# Altium schematic sheet Sheet5_Proteção_Bateria.SchDoc
size A4; SheetNumber: 5; SheetTotal: 6
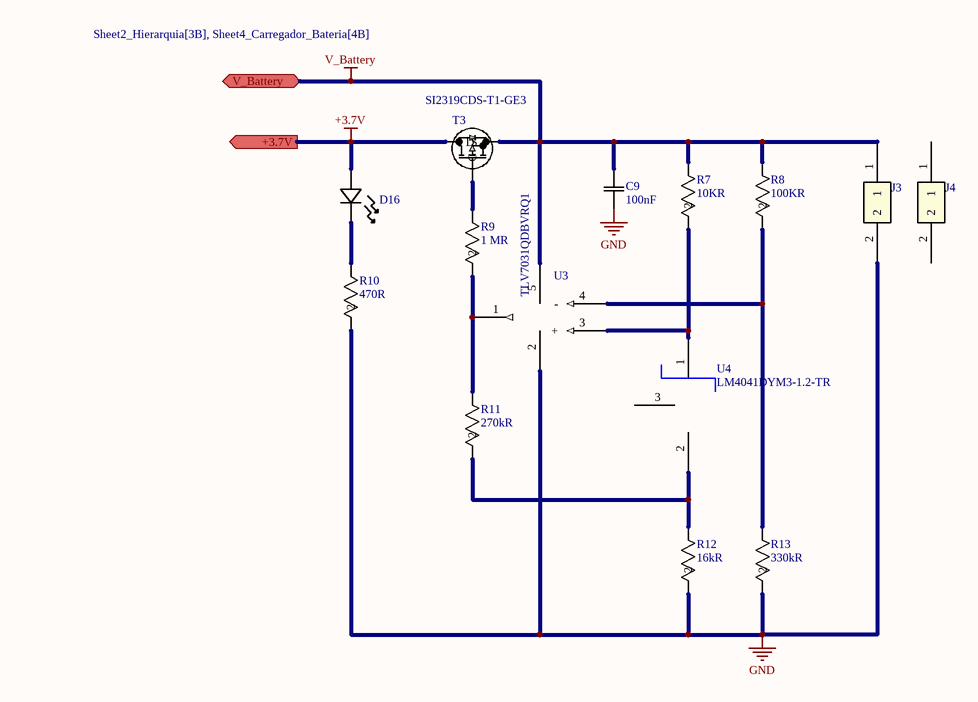
[diagram p0: Sheet5_Proteção_Bateria.SchDoc]

## Parts
?  (no value)  (graphical)
C9  100nF  [CAP_CL21_SAM]
D16  VAOL-S8SB4  [LED_VCCLITE_0805_VCC]  (value not drawn)
J3  TSW-101-07-G-D  [TSW-101-07-G-D_SAI]  (value not drawn)
J4  TSW-101-07-G-D  [TSW-101-07-G-D_SAI]  (value not drawn)
R7  10KR  [RES0805_CRG_TYCO_TYC]
R8  100KR  [RES0805_CRG_TYCO_TYC]
R9  1 MR  [RC0805N_PAN]
R10  470R  [RC0805N_VIS]
R11  270kR  [RC0805N_PAN]
R12  16kR  [RC0805N_PAN]
R13  330kR  [RC0805N_PAN]
T3  SI2319CDS-T1-GE3  [SOT-23-3_TO-236_VIS]
U3  TLV7031QDBVRQ1  [SOT_DBVRQ1_TEX]
U4  LM4041DYM3-1.2-TR  [SOT-23_MC_MCH]

## Ports
+3.7V (out, see Sheet2_Hierarquia[3B], Sheet6_Power_Path[2A]), V_Battery (bidir, see Sheet2_Hierarquia[3B], Sheet4_Carregador_Bateria[4B])

## Nets
+3.7V: D16.2 T3.3(D) ; port +3.7V
GND: C9.1 J3.2 R10.2 R12.2 R13.2 U3.2(VEE)
V_Battery: C9.2 J3.1 R7.1 R8.1 T3.2(S) U3.5(VCC) ; port V_Battery
NetD16_1: D16.1 R10.1
NetR7_2: R7.2 U3.3(+) U4.1(+)
NetR8_2: R8.2 R13.1 U3.4(-)
NetR9_1: R9.1 T3.1(G)
NetR9_2: R9.2 R11.1 U3.1(OUT)
NetR11_2: R11.2 R12.1 U4.2(-)

Not connected (* = marked no-connect by the designer): J4 1 2; U4 3(NC)

## Notes on the sheet
- Título:
- Endereço:
- Rua Aprígio Veloso, 1500 - Bodocongó
  CEP:58.429-140
  Campina Grande, Paraíba
  Brasil
- Projeto:
- Conta:
- Projetista:
- Arquivo:
- Data:
- Revisor:
- Pág.:
- Rev.:
- de

## Library data of the parts
? = Title Block
C9 = CL21B104KACNNNC: Description; Manufacturer_Name: Samsung; Copyright: Copyright (C) 2025 Ultra Librarian. All rights reserved.; Manufacturer_Part_Number: CL21B104KACNNNC
D16 = VAOL-S8SB4: No Description Available; Manufacturer_Name: VCC; Copyright: Copyright (C) 2026 Ultra Librarian. All rights reserved.; Manufacturer_Part_Number: VAOL-S8SB4
J3 J4 = TSW-101-07-G-D: No Description Available; Manufacturer_Name: Samtec Inc; Copyright: Copyright (C) 2026 Ultra Librarian. All rights reserved.; Manufacturer_Part_Number: TSW-101-07-G-D; RefDes: RefDes; Type: Type
R7 = CRG0805F10K: CRG0805 1% 10K; Manufacturer_Name: TE Connectivity; Copyright: Copyright (C) 2026 Ultra Librarian. All rights reserved.; Manufacturer_Part_Number: CRG0805F10K
R8 = CRG0805F100K: CRG0805 1% 100K; Manufacturer_Name: TE Connectivity; Copyright: Copyright (C) 2026 Ultra Librarian. All rights reserved.; Manufacturer_Part_Number: CRG0805F100K; Datasheet: https://www.te.com/commerce/DocumentDelivery/DDEController?Action=srchrtrv&DocNm=1773204&DocType=Data+Sheet&DocLang=English&PartCntxt=1623095-1&DocFormat=pdf
R9 = ERJ-6ENF1004V: Description; Manufacturer_Name: Panasonic; Copyright: Copyright (C) 2026 Ultra Librarian. All rights reserved.; Manufacturer_Part_Number: ERJ-6ENF1004V
R10 = CRCW0805470RJNEA: No Description Available; Manufacturer_Name: Vishay; Copyright: Copyright (C) 2026 Ultra Librarian. All rights reserved.; Manufacturer_Part_Number: CRCW0805470RJNEA; Datasheet: https://www.vishay.com/doc?20035
R11 = ERJ-6ENF2703V: No Description Available; Manufacturer_Name: Panasonic; Copyright: Copyright (C) 2026 Ultra Librarian. All rights reserved.; Manufacturer_Part_Number: ERJ-6ENF2703V
R12 = ERJ-6ENF1602V: No Description Available; Manufacturer_Name: Panasonic; Copyright: Copyright (C) 2026 Ultra Librarian. All rights reserved.; Manufacturer_Part_Number: ERJ-6ENF1602V
R13 = ERJ-6ENF3303V: No Description Available; Manufacturer_Name: Panasonic; Copyright: Copyright (C) 2026 Ultra Librarian. All rights reserved.; Manufacturer_Part_Number: ERJ-6ENF3303V
T3 = SI2319CDS-T1-GE3: P-CHANNEL 40-V (D-S) MOSFET; Manufacturer_Name: Vishay; Copyright: Copyright (C) 2026 Ultra Librarian. All rights reserved.; Manufacturer_Part_Number: SI2319CDS-T1-GE3; Datasheet: https://www.vishay.com/doc?66709
U3 = TLV7031QDBVRQ1: Automotive nano power comparator with push-pull output 5-SOT-23 -40 to 125; Manufacturer_Name: Texas Instruments; Copyright: Copyright (C) 2026 Ultra Librarian. All rights reserved.; Manufacturer_Part_Number: TLV7031QDBVRQ1; Datasheet: https://www.ti.com/lit/gpn/tlv7031-q1; RefDes: RefDes; Type: Type
U4 = LM4041DYM3-1.2-TR: No Description Available; Manufacturer_Name: Microchip; Copyright: Copyright (C) 2026 Ultra Librarian. All rights reserved.; Manufacturer_Part_Number: LM4041DYM3-1.2-TR; RefDes: RefDes; Type: Type